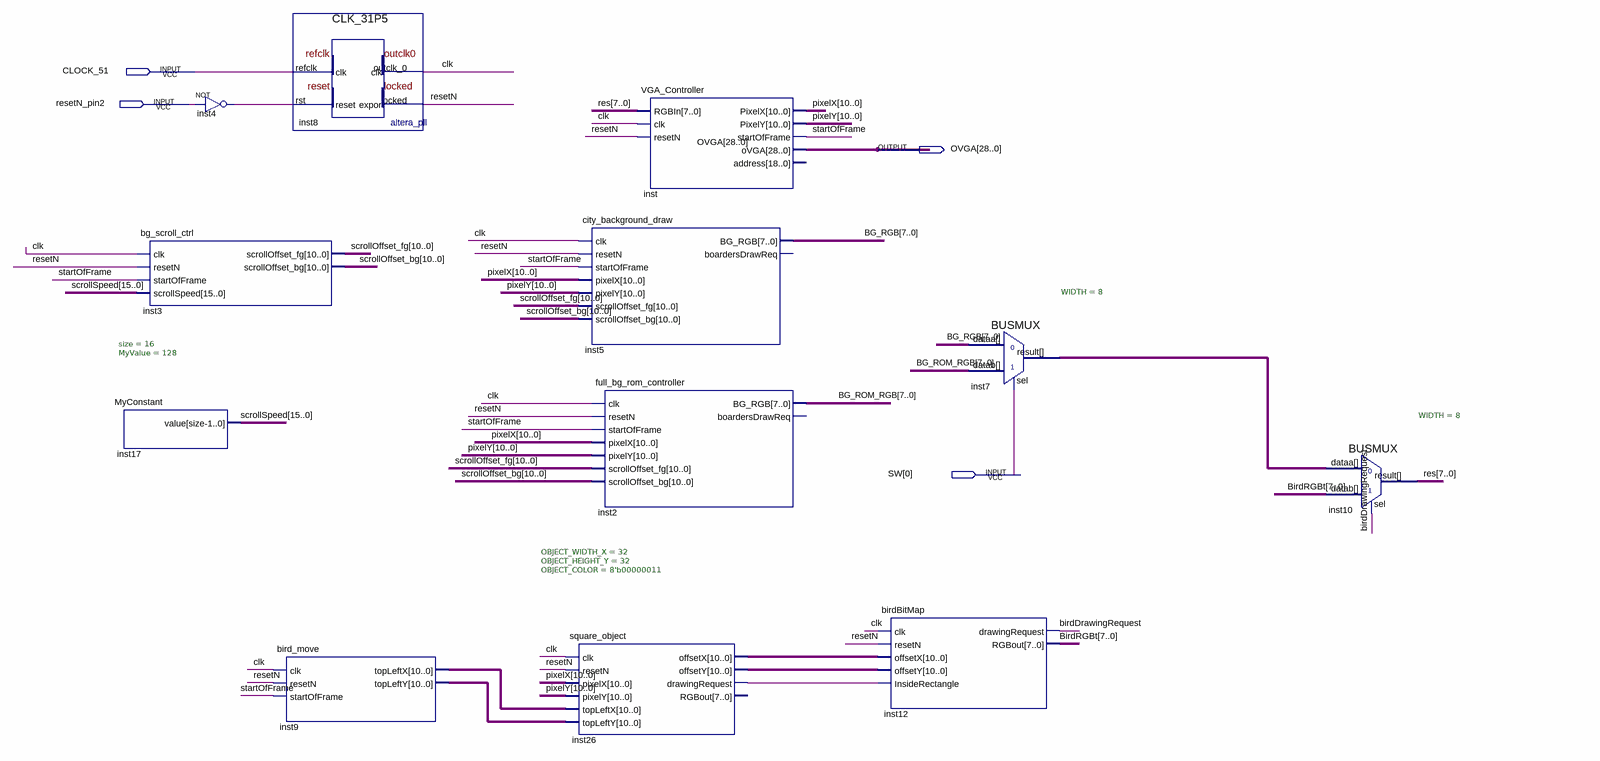
[diagram p0: schematic sheet]
// Quartus schematic TEST_BG_DEMO.bdf as structural Verilog: 12 symbols, 4 pins
module TEST_BG_DEMO (
  input  CLOCK_51,
  input  resetN_pin2,
  input  [0:0] SW,
  output [28:0] OVGA
);

  wire birdDrawingRequest, clk, inst4_out, inst26_drawingrequest, resetN, startOfFrame;
  wire [7:0] BG_RGB, BG_ROM_RGB, BirdRGBt, inst7_result, res;
  wire [10:0] inst9_topleftx, inst9_toplefty, inst26_offsetx, inst26_offsety, pixelX, pixelY,
       scrollOffset_bg, scrollOffset_fg;
  wire [15:0] scrollSpeed;

  bg_scroll_ctrl inst3 (
    .clk(clk), .resetN(resetN), .startOfFrame(startOfFrame), .scrollSpeed(scrollSpeed),
    .scrollOffset_fg(scrollOffset_fg), .scrollOffset_bg(scrollOffset_bg));
  MyConstant #(.size(16), .MyValue(128)) inst17 (.value(scrollSpeed));
  not inst4 (inst4_out, resetN_pin2);
  CLK_31P5 inst8 (.refclk(CLOCK_51), .rst(inst4_out), .outclk_0(clk), .locked(resetN));
  bird_move inst9 (
    .clk(clk), .resetN(resetN), .startOfFrame(startOfFrame), .topLeftX(inst9_topleftx),
    .topLeftY(inst9_toplefty));
  city_background_draw inst5 (
    .clk(clk), .resetN(resetN), .startOfFrame(startOfFrame), .pixelX(pixelX), .pixelY(pixelY),
    .scrollOffset_fg(scrollOffset_fg), .scrollOffset_bg(scrollOffset_bg), .BG_RGB(BG_RGB));  // open: boardersDrawReq
  full_bg_rom_controller inst2 (
    .clk(clk), .resetN(resetN), .startOfFrame(startOfFrame), .pixelX(pixelX), .pixelY(pixelY),
    .scrollOffset_fg(scrollOffset_fg), .scrollOffset_bg(scrollOffset_bg), .BG_RGB(BG_ROM_RGB));  // open: boardersDrawReq
  square_object #(.OBJECT_WIDTH_X(32), .OBJECT_HEIGHT_Y(32), .OBJECT_COLOR(8'b00000011)) inst26 (
    .clk(clk), .resetN(resetN), .pixelX(pixelX), .pixelY(pixelY), .topLeftX(inst9_topleftx),
    .topLeftY(inst9_toplefty), .offsetX(inst26_offsetx), .offsetY(inst26_offsety),
    .drawingRequest(inst26_drawingrequest));  // open: RGBout
  VGA_Controller inst (
    .RGBIn(res), .clk(clk), .resetN(resetN), .PixelX(pixelX), .PixelY(pixelY), .startOfFrame(startOfFrame),
    .oVGA(OVGA));  // open: address
  birdBitMap inst12 (
    .clk(clk), .resetN(resetN), .offsetX(inst26_offsetx), .offsetY(inst26_offsety),
    .InsideRectangle(inst26_drawingrequest), .drawingRequest(birdDrawingRequest), .RGBout(BirdRGBt));
  BUSMUX #(.WIDTH(8)) inst7 (.datab(BG_ROM_RGB), .sel(SW[0]), .dataa(BG_RGB), .result(inst7_result));
  BUSMUX #(.WIDTH(8)) inst10 (.datab(BirdRGBt), .sel(birdDrawingRequest), .dataa(inst7_result), .result(res));
endmodule
